# Altium schematic sheet Peripherals.SchDoc
size A; SheetNumber: 3; SheetTotal: 3
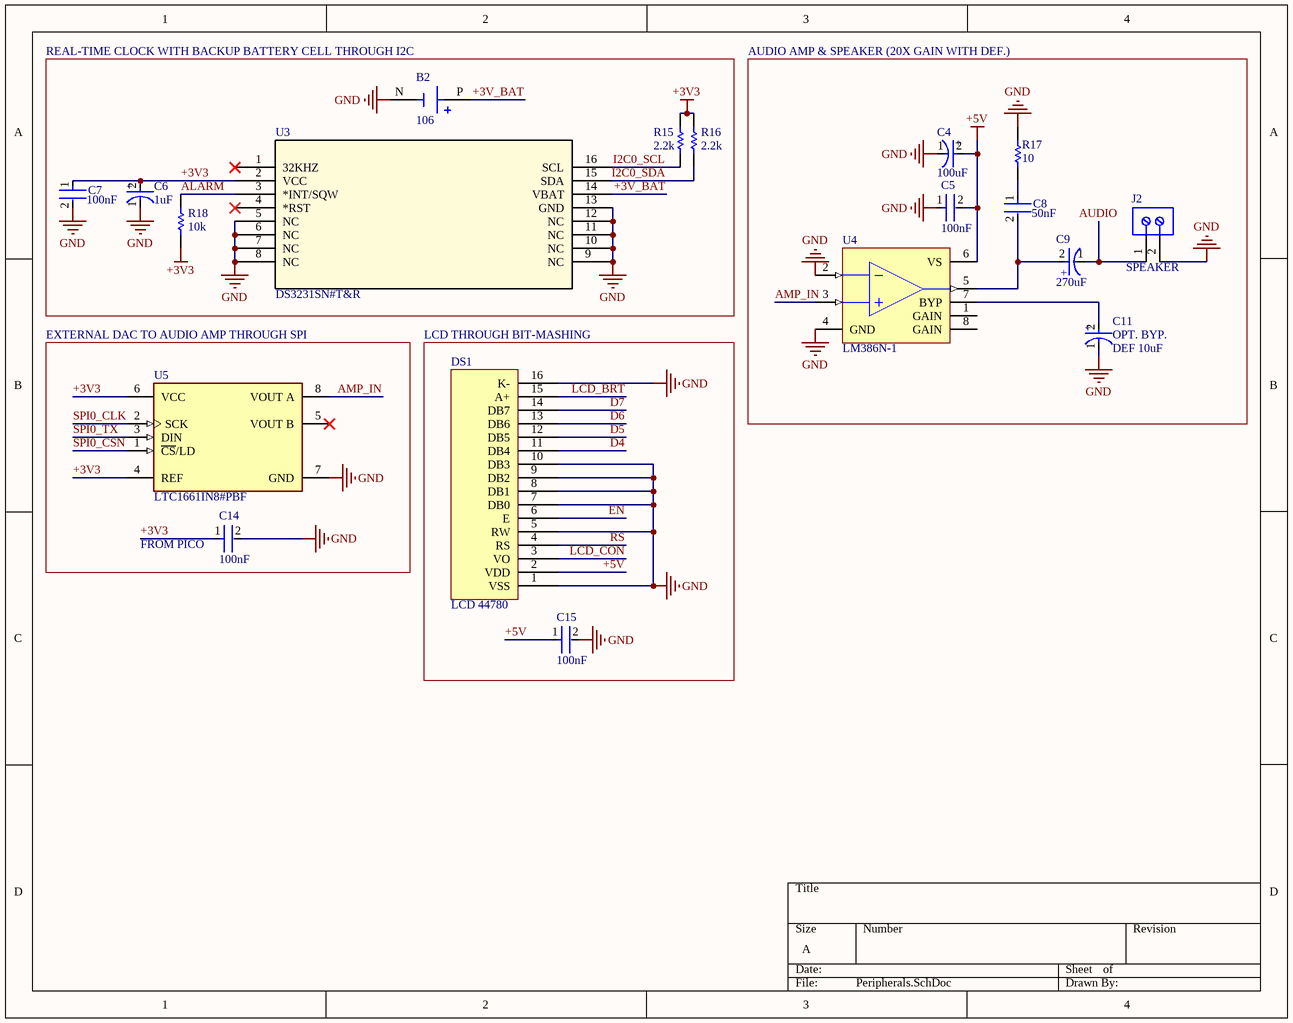
[diagram p0: Peripherals.SchDoc]

## Parts
B2  106  [BAT_106]
C4  Capacitance: 100uF  [FP-RAD-TH-D_6_3_0_5-L_11-MFG]  (hidden comment: EEUFM1E101B)
C5  Capacitance: 100nF  [FP-RDE3M1-MFG]  (hidden comment: RDED72W104K3K1H03B)
C6  Capacitance: 1uF  [FP-RAD-TH-D_6_3_0_5-L_11-MFG]  (hidden comment: EEUFM1E101B)
C7  Capacitance: 100nF  [FP-RDE3M1-MFG]  (hidden comment: RDED72W104K3K1H03B)
C8  Capacitance: 50nF  [FP-RDE3M1-MFG]  (hidden comment: RDED72W104K3K1H03B)
C9  Capacitor: 270uF  [FP-RAD-TH-D_12_5_0_5-L_20-MFG]  (hidden comment: EEUFS1K271B)
C11  Capacitance: OPT. BYP.  [FP-RAD-TH-D_6_3_0_5-L_11-MFG]  (hidden comment: EEUFM1E101B)
C14  Capacitance: 100nF  [FP-RDE3M1-MFG]  (hidden comment: RDED72W104K3K1H03B)
C15  Capacitance: 100nF  [FP-RDE3M1-MFG]  (hidden comment: RDED72W104K3K1H03B)
DS1  LCD 44780  [OLED 16x2]
J2  1714955  [PHOE-1714955_V]  (value not drawn)
R15  Resistance: 2.2k  [RESA60-630X240]  (hidden comment: MFR-25FBF52-1M)
R16  Resistance: 2.2k  [RESA60-630X240]  (hidden comment: MFR-25FBF52-1M)
R17  Resistance: 10  [RESA60-630X240]  (hidden comment: MFR-25FBF52-1M)
R18  Resistance: 10k  [RESA60-630X240]  (hidden comment: MFR-25FBF52-1M)
U3  DS3231SN#T&R  [21-0042B_16_MXM]
U4  LM386N-1  [DIP-8]
U5  LTC1661IN8#PBF  [FP-N-8-05-08-1510-MFG]

## Blocks framed on the sheet
REAL-TIME CLOCK WITH BACKUP BATTERY CELL THROUGH I2C: B2 C6 C7 R15 R16 R18 U3
LCD THROUGH BIT-MASHING: C15 DS1

## Nets
+3V3: C6.2(A) C7.1 C14.1 R15.2 R16.2 R18.1 U3.2(VCC) U5.4(REF) U5.6(VCC)
+5V: C4.2(A) C5.2 C15.1 DS1.2(VDD) U4.6(VS)
GND: B2.N(NEG) C4.1(C) C5.1 C6.1(C) C7.2 C11.1(C) C14.2 C15.2 DS1.1(VSS) DS1.5(RW) DS1.7(DB0) DS1.8(DB1) DS1.9(DB2) DS1.10(DB3) DS1.16(K-) J2.2 R17.1 U3.5(NC) U3.6(NC) U3.7(NC) U3.8(NC) U3.9(NC) U3.10(NC) U3.11(NC) U3.12(NC) U3.13(GND) U4.2(IN-) U4.4(GND) U5.7(GND)
+3V_BAT: B2.P(POS) U3.14(VBAT)
ALARM: R18.2 U3.3(*INT/SQW)
AMP_IN: U4.3(IN+) U5.8(VOUT_A)
AUDIO: C9.1(C) J2.1
D4: DS1.11(DB4)
D5: DS1.12(DB5)
D6: DS1.13(DB6)
D7: DS1.14(DB7)
EN: DS1.6(E)
I2C0_SCL: R15.1 U3.16(SCL)
I2C0_SDA: R16.1 U3.15(SDA)
LCD_BRT: DS1.15(A+)
LCD_CON: DS1.3(VO)
RS: DS1.4(RS)
SPI0_CLK: U5.2(SCK)
SPI0_CSN: U5.1(~{CS}/LD)
SPI0_TX: U5.3(DIN)
NetC8_1: C8.1 R17.2
NetC8_2: C8.2 C9.2(A) U4.5(OUT)
NetC11_2: C11.2(A) U4.7(BYP)

Not connected (* = marked no-connect by the designer): U3 1(32KHZ)* 4(*RST)*; U4 1(GAIN) 8(GAIN); U5 5(VOUT_B)*

## Notes on the sheet
- AUDIO AMP & SPEAKER (20X GAIN WITH DEF.)
- (near J2) SPEAKER
- EXTERNAL DAC TO AUDIO AMP THROUGH SPI
- (near C11) DEF 10uF
- (near C14) FROM PICO
- (in symbol CMP-05427-000433-1) +
- (in symbol CMP-05427-000856-1) +

## Library data of the parts
B2 = 106: Battery Holder, Heavy Duty, THM, Plastic, 1 Cell, 20mm | Keystone Electronics 106; SnapEDA_Link: https://www.snapeda.com/parts/106/Keystone/view-part/?ref=snap; Package: None; Value: *; MF: Keystone Electronics; MP: 106; Check_prices: https://www.snapeda.com/parts/106/Keystone/view-part/?ref=eda
C4 C6 C11 = CMP-05427-000856-1: Aluminum Electrolytic Capacitors (Radial Lead Type) 100uF ±20% 25V; Lead Diameter: 0.5mm; Polarity: Polar; Ripple Current: 455mA; Impedance: 130mR; Life (Hours): 2000Hour; Length: 11mm; Min Operating Temperature: -40°C; Termination: Radial; Diameter: 6mm; Lead Pitch: 5mm; Tolerance: 20%; Case/Package: Radial; Voltage Rating (DC): 25V; Height - Seated (Max): 0.5inch; RoHS Compliant: Yes; Series: FM; Package Quantity: 2000; Voltage Rating: 25V; Max Operating Temperature: 105°C; Mount: Through Hole; ESR (Equivalent Series Resistance): 130mR; Packaging: Tape and Reel
C5 C7 C8 C14 C15 = CMP-06035-016817-1: Ceramic Capacitor 100nF ±10% 450V X7T Radial; Tolerance: 10%; Voltage Rating: 450V; Lead Pitch: 5mm; Max Operating Temperature: 125°C; Voltage Rating (DC): 450V; Case/Package: Radial; Dielectric: X7T; Min Operating Temperature: -55°C; REACH SVHC: No SVHC
C9 = CMP-05427-000433-1: Aluminum Electrolytic Capacitors (Radial Lead Type) 270uF ±20% 80V; RoHS Compliant: Yes
J2 = CMP-2000-05797-1: PC Terminal Block, Pitch 6.35 mm, 1 x 2 Position, Height 21.5 mm, Tail Lenght 5.1 mm, RoHS, Bulk; Manufacturer: Phoenix Contact; Package Description: PC Terminal Block, Pitch 6.35 mm, 1 x 2 Position, Height 21.5 mm, Tail Lenght 5.1 mm; Datasheet URL: http://media.digikey.com/pdf/Data%20Sheets/Phoenix%20Contact%20PDFs/1714955.pdf; Package Reference: 1714955; Manufacturer URL: http://www.phoenixcontact.com/; Datasheet Version: 02/2010; Mounting Technology: ThroughHole
R15-R18 = CMP-1659-00070-1: Axial Resistor, 1 MOhm, +/- 1%, 250 mW, -55 to 155 degC, 2-Pin THD, RoHS, Bulk; Power Rating: 250 mW; Voltage Rating: 250 V; ComponentLink1Description: Manufacturer URL; PackageReference: MFR-25; ComponentLink2Description: Datasheet; ComponentLink2URL: http://www.yageo.com/documents/recent/Yageo%20LR_MFR_2013.pdf; Tolerance: 1%; DatasheetVersion: Apr-13; Package Quantity: 200; Packaging: Bulk; Case\Package: Axial; RoHSCompliant: true; ComponentLink1URL: http://www.yageo.com/; Length: 0.248 inch; Min Operating Temperature: -55 degC; Mount: Through Hole; PackageDescription: 2-Pin Axial Lead, Dia 2.4 mm, Body Length 6.3 mm; Max Operating Temperature: 155 degC
U3 = DS3231SNTR: Extremely Accurate IÂ²C-Integrated RTC/TCXO/Crystal; Manufacturer_Name: Analog Devices Inc; Copyright: Copyright (C) 2025 Ultra Librarian. All rights reserved.; Manufacturer_Part_Number: DS3231SN#T&R; RefDes: RefDes; Type: Type
U4 = LM386N-1: Low-Voltage Audio Power Amplifier; Published: 15-Apr-2002; DatasheetDocument: Sep-1997; PackageDocument: Sep-1997; PackageReference: N08E; Publisher: Altium Limited
U5 = CMP-00026-88317689-1: LTC1661IN8#PBF Dual Serial Input Loading 30 Us Settling Time 10-BIT Dac PDIP8; Manufacturer Lifecycle Status: PRODUCTION; Min Supply Voltage: 2.7V; Resolution: 1.25B; Number of Bits: 10; Output Type: Voltage; Max Supply Voltage: 5.5V; Integral Nonlinearity (INL): 2LSB; Supply Type: Single; Settling Time: 30µs; Number of Converters: 2; Case/Package: DIP; Lifecycle Status: Production; NexarPartId: 88317689; Number of Pins: 8; RoHS: Compliant; Min Operating Temperature: -40°C; Max Operating Temperature: 85°C; Interface: Serial; Lead Free: Lead Free; Mount: Through Hole; Number of Channels: 2